# Altium schematic sheet ADV7180.SchDoc
size A3; SheetNumber: 5; SheetTotal: 8
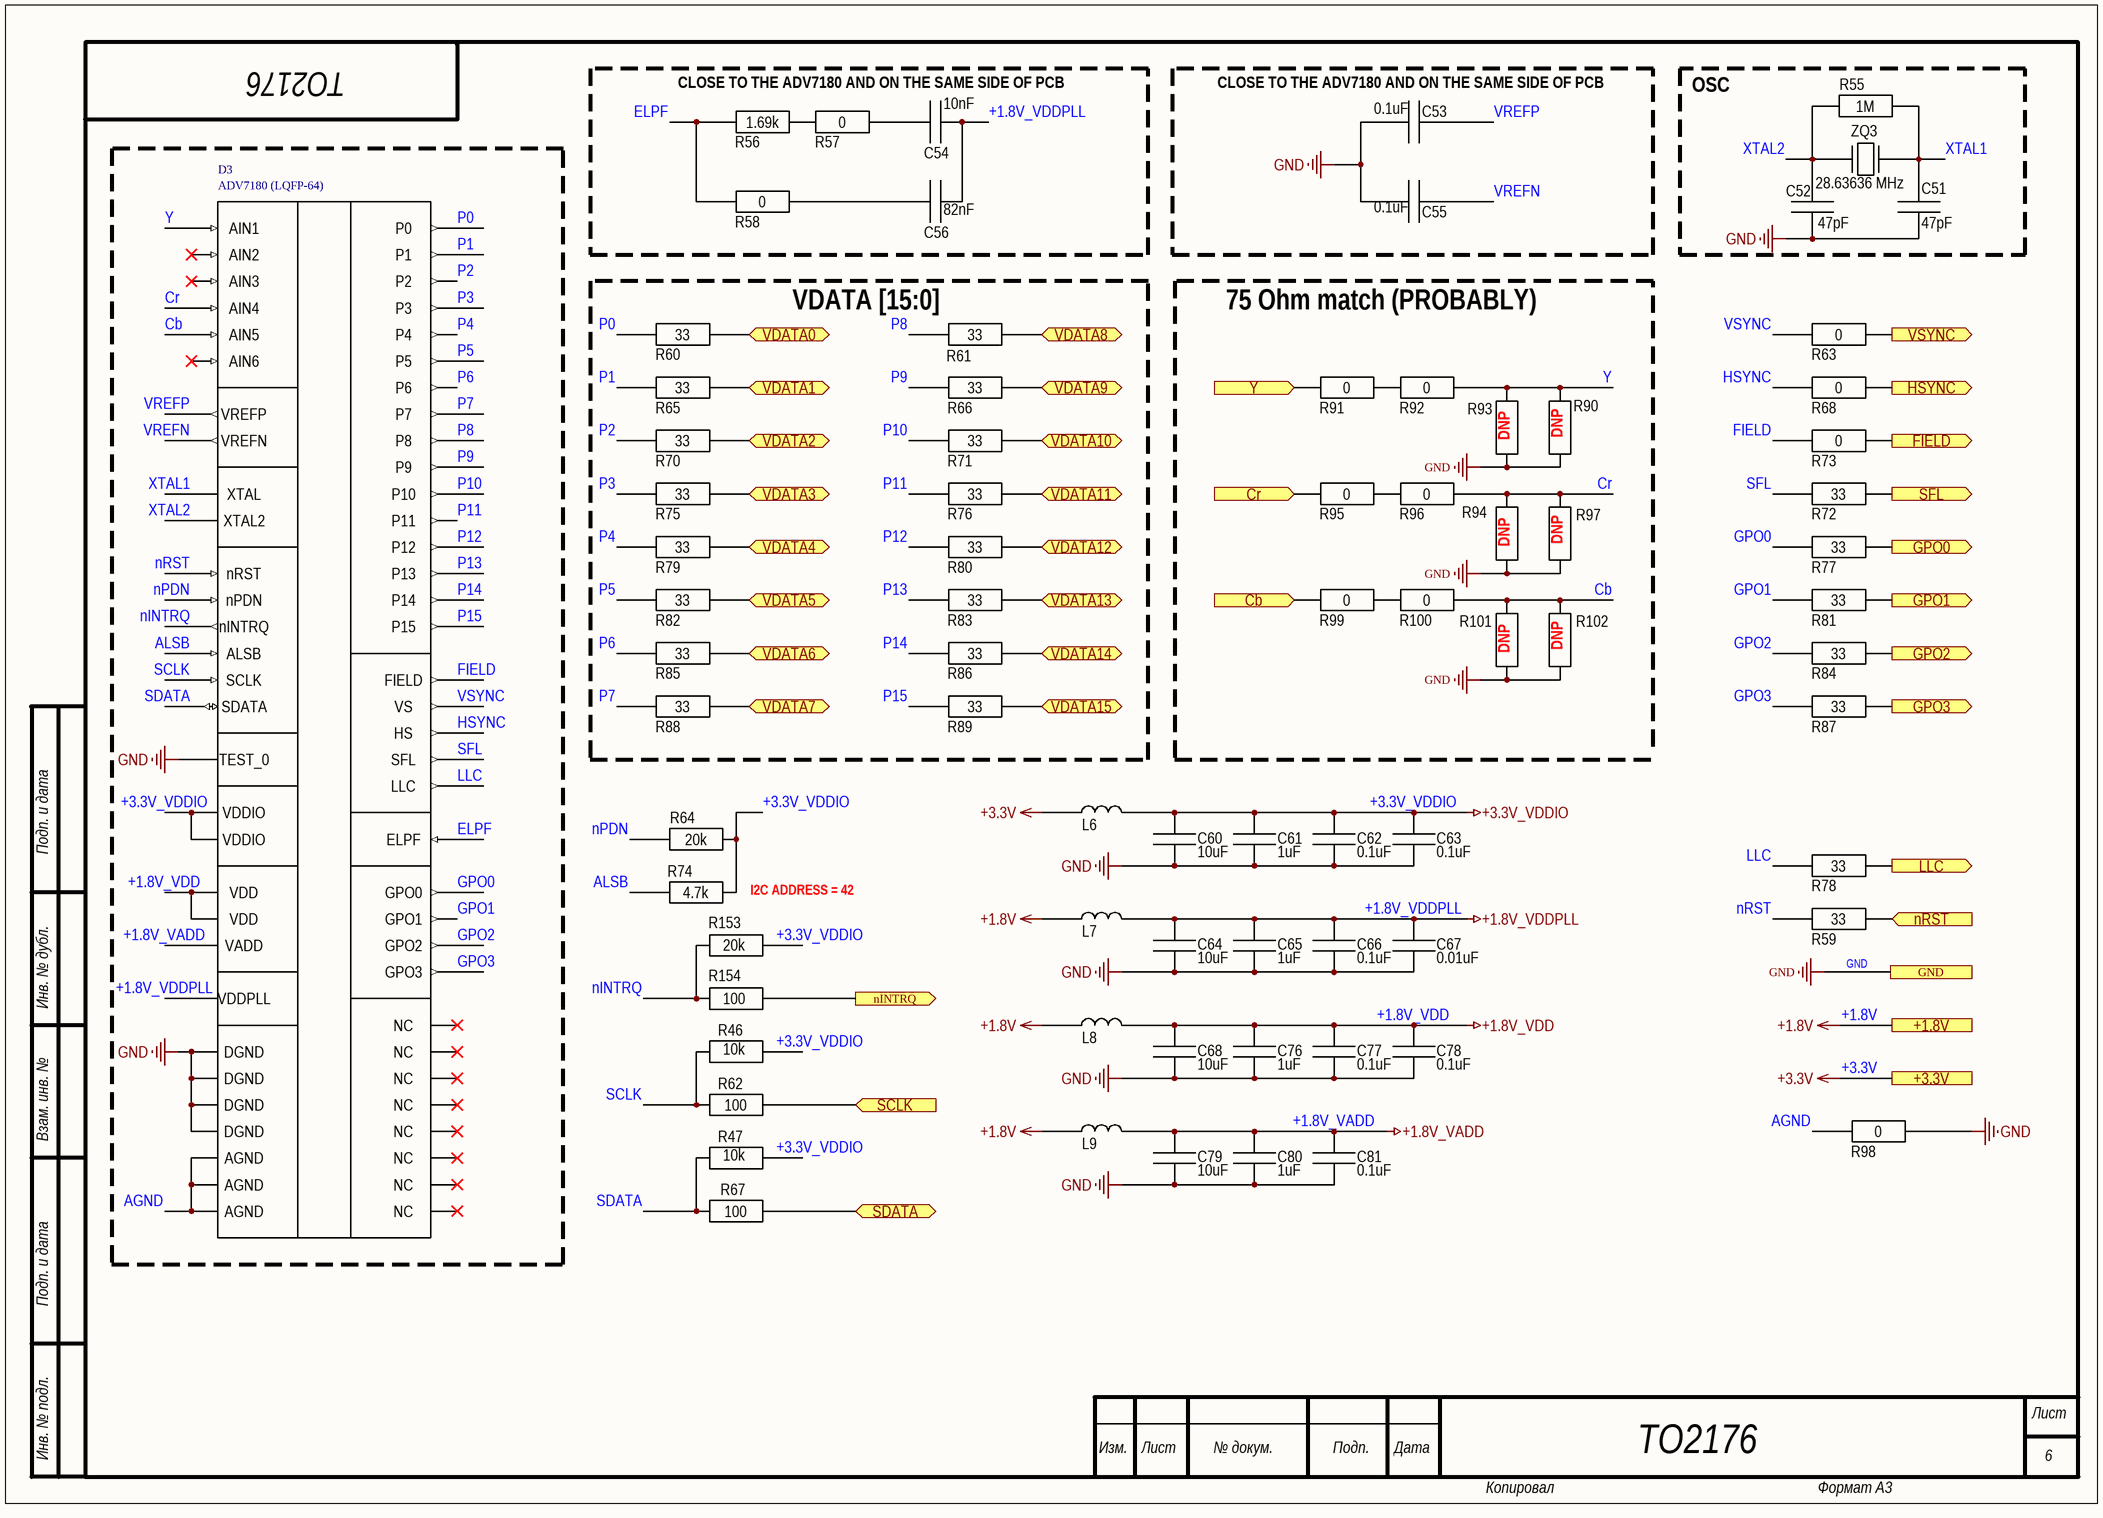
[diagram p0: ADV7180.SchDoc]

## Parts
C51  47pF  [0603]
C52  47pF  [0603]
C53  0.1uF  [0603]
C54  10nF  [0603]
C55  0.1uF  [0603]
C56  82nF  [0603]
C60  10uF  [0603]
C61  1uF  [0603]
C62  0.1uF  [0603]
C63  0.1uF  [0603]
C64  10uF  [0603]
C65  1uF  [0603]
C66  0.1uF  [0603]
C67  0.01uF  [0603]
C68  10uF  [0603]
C76  1uF  [0603]
C77  0.1uF  [0603]
C78  0.1uF  [0603]
C79  10uF  [0603]
C80  1uF  [0603]
C81  0.1uF  [0603]
D3  ADV7180 (LQFP-64)  [LQFP-64]
L6  BLM18AG221SN1D (0603)  [0805]  (value not drawn)
L7  BLM18AG221SN1D (0603)  [0805]  (value not drawn)
L8  BLM18AG221SN1D (0603)  [0805]  (value not drawn)
L9  BLM18AG221SN1D (0603)  [0805]  (value not drawn)
R46  10k  [0603]
R47  10k  [0603]
R55  1M  [0603]
R56  1.69k  [0603]
R57  0  [0603]
R58  0  [0603]
R59  33  [0603]
R60  33  [0603]
R61  33  [0603]
R62  100  [0603]
R63  0  [0603]
R64  20k  [0603]
R65  33  [0603]
R66  33  [0603]
R67  100  [0603]
R68  0  [0603]
R70  33  [0603]
R71  33  [0603]
R72  33  [0603]
R73  0  [0603]
R74  4.7k  [0603]
R75  33  [0603]
R76  33  [0603]
R77  33  [0603]
R78  33  [0603]
R79  33  [0603]
R80  33  [0603]
R81  33  [0603]
R82  33  [0603]
R83  33  [0603]
R84  33  [0603]
R85  33  [0603]
R86  33  [0603]
R87  33  [0603]
R88  33  [0603]
R89  33  [0603]
R90  DNP  [0805]
R91  0  [0805]
R92  0  [0603]
R93  DNP  [0603]
R94  DNP  [0603]
R95  0  [0805]
R96  0  [0603]
R97  DNP  [0805]
R98  0  [0603]
R99  0  [0805]
R100  0  [0603]
R101  DNP  [0603]
R102  DNP  [0805]
R153  20k  [0603]
R154  100  [0603]
ZQ3  28.63636 MHz  [ABM3]

## Blocks framed on the sheet
CLOSE TO THE ADV7180 AND ON THE SAME SIDE OF PCB: C54 C56 R56-R58
CLOSE TO THE ADV7180 AND ON THE SAME SIDE OF PCB: C53 C55
OSC: C51 C52 R55 ZQ3
VDATA [15:0]: R60 R61 R65 R66 R70 R71 R75 R76 R79 R80 R82 R83 R85 R86 R88 R89

## Ports
+1.8V, +3.3V, Cb (in), Cr (in), FIELD (out), GND, GPO0 (out), GPO1 (out), GPO2 (out), GPO3 (out), HSYNC (out), LLC (out), nINTRQ (out), nRST (in), SCLK (in), SDATA (bidir), SFL (out), VDATA0 (bidir), VDATA1 (bidir), VDATA2 (bidir), VDATA3 (bidir), VDATA4 (bidir), VDATA5 (bidir), VDATA6 (bidir), VDATA7 (bidir), VDATA8 (bidir), VDATA9 (bidir), VDATA10 (bidir), VDATA11 (bidir), VDATA12 (bidir), VDATA13 (bidir), VDATA14 (bidir), VDATA15 (bidir), VSYNC (out), Y (in)

## Nets
+1.8V: L7.1 L8.1 L9.1 ; port +1.8V
+1.8V_VADD: C79.2 C80.2 C81.2 D3.40 L9.2
+1.8V_VDD: C68.2 C76.2 C77.2 C78.2 D3.23 D3.58 L8.2
+1.8V_VDDPLL: C54.2 C56.2 C64.2 C65.2 C66.2 C67.2 D3.31 L7.2
+3.3V: L6.1 ; port +3.3V
+3.3V_VDDIO: C60.2 C61.2 C62.2 C63.2 D3.4 D3.11 L6.2 R46.2 R47.2 R64.2 R74.2 R153.2
GND: C51.2 C52.2 C53.1 C55.1 C60.1 C61.1 C62.1 C63.1 C64.1 C65.1 C66.1 C67.1 C68.1 C76.1 C77.1 C78.1 C79.1 C80.1 C81.1 D3.3 D3.10 D3.24 D3.34 D3.57 R90.1 R93.1 R94.1 R97.1 R98.2 R101.1 R102.1 ; port GND
AGND: D3.32 D3.37 D3.43 R98.1
ALSB: D3.52 R74.1
Cb: D3.48 R100.2 R101.2 R102.2
Cb: R99.1 ; port Cb  [a separate net that carries the same name]
Cr: D3.47 R94.2 R96.2 R97.2
Cr: R95.1 ; port Cr  [a separate net that carries the same name]
ELPF: D3.30 R56.1 R58.1
FIELD: D3.63 R73.1
FIELD: R73.2 ; port FIELD  [a separate net that carries the same name]
GPO0: D3.13 R77.1
GPO0: R77.2 ; port GPO0  [a separate net that carries the same name]
GPO1: D3.12 R81.1
GPO1: R81.2 ; port GPO1  [a separate net that carries the same name]
GPO2: D3.56 R84.1
GPO2: R84.2 ; port GPO2  [a separate net that carries the same name]
GPO3: D3.55 R87.1
GPO3: R87.2 ; port GPO3  [a separate net that carries the same name]
HSYNC: D3.2 R68.1
HSYNC: R68.2 ; port HSYNC  [a separate net that carries the same name]
LLC: D3.20 R78.1
LLC: R78.2 ; port LLC  [a separate net that carries the same name]
nINTRQ: D3.1 R153.1 R154.2
nINTRQ: R154.1 ; port nINTRQ  [a separate net that carries the same name]
nPDN: D3.29 R64.1
nRST: D3.51 R59.1
nRST: R59.2 ; port nRST  [a separate net that carries the same name]
P0: D3.26 R60.1
P1: D3.25 R65.1
P2: D3.19 R70.1
P3: D3.18 R75.1
P4: D3.17 R79.1
P5: D3.16 R82.1
P6: D3.15 R85.1
P7: D3.14 R88.1
P8: D3.8 R61.1
P9: D3.7 R66.1
P10: D3.6 R71.1
P11: D3.5 R76.1
P12: D3.62 R80.1
P13: D3.61 R83.1
P14: D3.60 R86.1
P15: D3.59 R89.1
SCLK: D3.54 R46.1 R62.1
SCLK: R62.2 ; port SCLK  [a separate net that carries the same name]
SDATA: D3.53 R47.1 R67.1
SDATA: R67.2 ; port SDATA  [a separate net that carries the same name]
SFL: D3.9 R72.1
SFL: R72.2 ; port SFL  [a separate net that carries the same name]
VDATA0: R60.2 ; port VDATA0
VDATA1: R65.2 ; port VDATA1
VDATA2: R70.2 ; port VDATA2
VDATA3: R75.2 ; port VDATA3
VDATA4: R79.2 ; port VDATA4
VDATA5: R82.2 ; port VDATA5
VDATA6: R85.2 ; port VDATA6
VDATA7: R88.2 ; port VDATA7
VDATA8: R61.2 ; port VDATA8
VDATA9: R66.2 ; port VDATA9
VDATA10: R71.2 ; port VDATA10
VDATA11: R76.2 ; port VDATA11
VDATA12: R80.2 ; port VDATA12
VDATA13: R83.2 ; port VDATA13
VDATA14: R86.2 ; port VDATA14
VDATA15: R89.2 ; port VDATA15
VREFN: C55.2 D3.39
VREFP: C53.2 D3.38
VSYNC: D3.64 R63.1
VSYNC: R63.2 ; port VSYNC  [a separate net that carries the same name]
XTAL1: C51.1 D3.21 R55.2 ZQ3.2
XTAL2: C52.1 D3.22 R55.1 ZQ3.1
Y: D3.35 R90.2 R92.2 R93.2
Y: R91.1 ; port Y  [a separate net that carries the same name]
NetC54_1: C54.1 R57.2
NetC56_1: C56.1 R58.2
NetR56_2: R56.2 R57.1
NetR91_2: R91.2 R92.1
NetR95_2: R95.2 R96.1
NetR99_2: R99.2 R100.1

Not connected (* = marked no-connect by the designer): D3 27* 28* 33* 36* 41* 42* 44* 45* 46* 49* 50*

## Notes on the sheet
- ТО2176
- 75 Ohm match (PROBABLY)
- Подп. и дата
- (near R74) I2C ADDRESS = 42
- Инв. № дубл.
- Взам. инв. №
- Инв. № подл.
- Изм.
- Лист
- № докум.
- Подп.
- Дата
- 6
- Копировал
- Формат А3
- (in symbol ADV7180 (LQFP-64)) AIN1; P0; AIN2; P1; AIN3; P2; AIN4; P3; AIN5; P4; AIN6; P5; P6; VREFP; P7; VREFN; P8; P9; XTAL; P10; XTAL2; P11; P12; nRST; P13; nPDN; P14; nINTRQ; P15; ALSB; SCLK; FIELD; SDATA; VS; HS; TEST_0; SFL; LLC; VDDIO; ELPF; VDD; GPO0; GPO1; VADD; GPO2; GPO3; VDDPLL; NC; DGND; AGND

## Library data of the parts
C51-C56 C60-C68 C76-C81 = C0603: ComponentHeigt: 1.3; Firme: AVX; Leadform: SMD; KIND: Конденсатор; ClassName: *; Component Link: *; ComponentWeigt: *; Packaging: 0805; NN: *; Value: *
L6-L9 = BLM21(0805) Murata: ComponentHeigt: 1.1; Leadform: SMD; Firme: Murata; ClassName: *; Component Link: *; ComponentWeigt: *; Packaging: 1206; NN: *; KIND: *
R46 R47 R55-R68 R70-R89 R92-R94 R96 R98 R100 R101 R153 R154 = R0603 Yageo: ComponentHeigt: 0.5; Leadform: SMD; Firme: Yageo; Kind: Резистор; Packaging: 0402; ClassName: *; Component Link: *; NN: *
R90 R91 R95 R97 R99 R102 = R0805 Yageo: ComponentHeigt: 0.6; Firme: Yageo; Leadform: SMD; Kind: Резистор; ClassName: *; ComponentWeigt: *; Component Link: *; Packaging: 0805; NN: *; Value: *
ZQ3 = ABM3: ABM3-28.63636MHZ